# Altium schematic sheet PowerSupply.SchDoc
size 431 x 279 mm; Organization: ORGANIZATION; Address1: ADDRESS 1; Address2: ADDRESS 2; Address3: ADDRESS 3; Address4: ADDRESS 4; Revision: -; SheetNumber: 3; SheetTotal: 5; ENG_APP_DATE: --/--/--; DSN_APP_DATE: --/--/--; CHK_APP_DATE: --/--/--
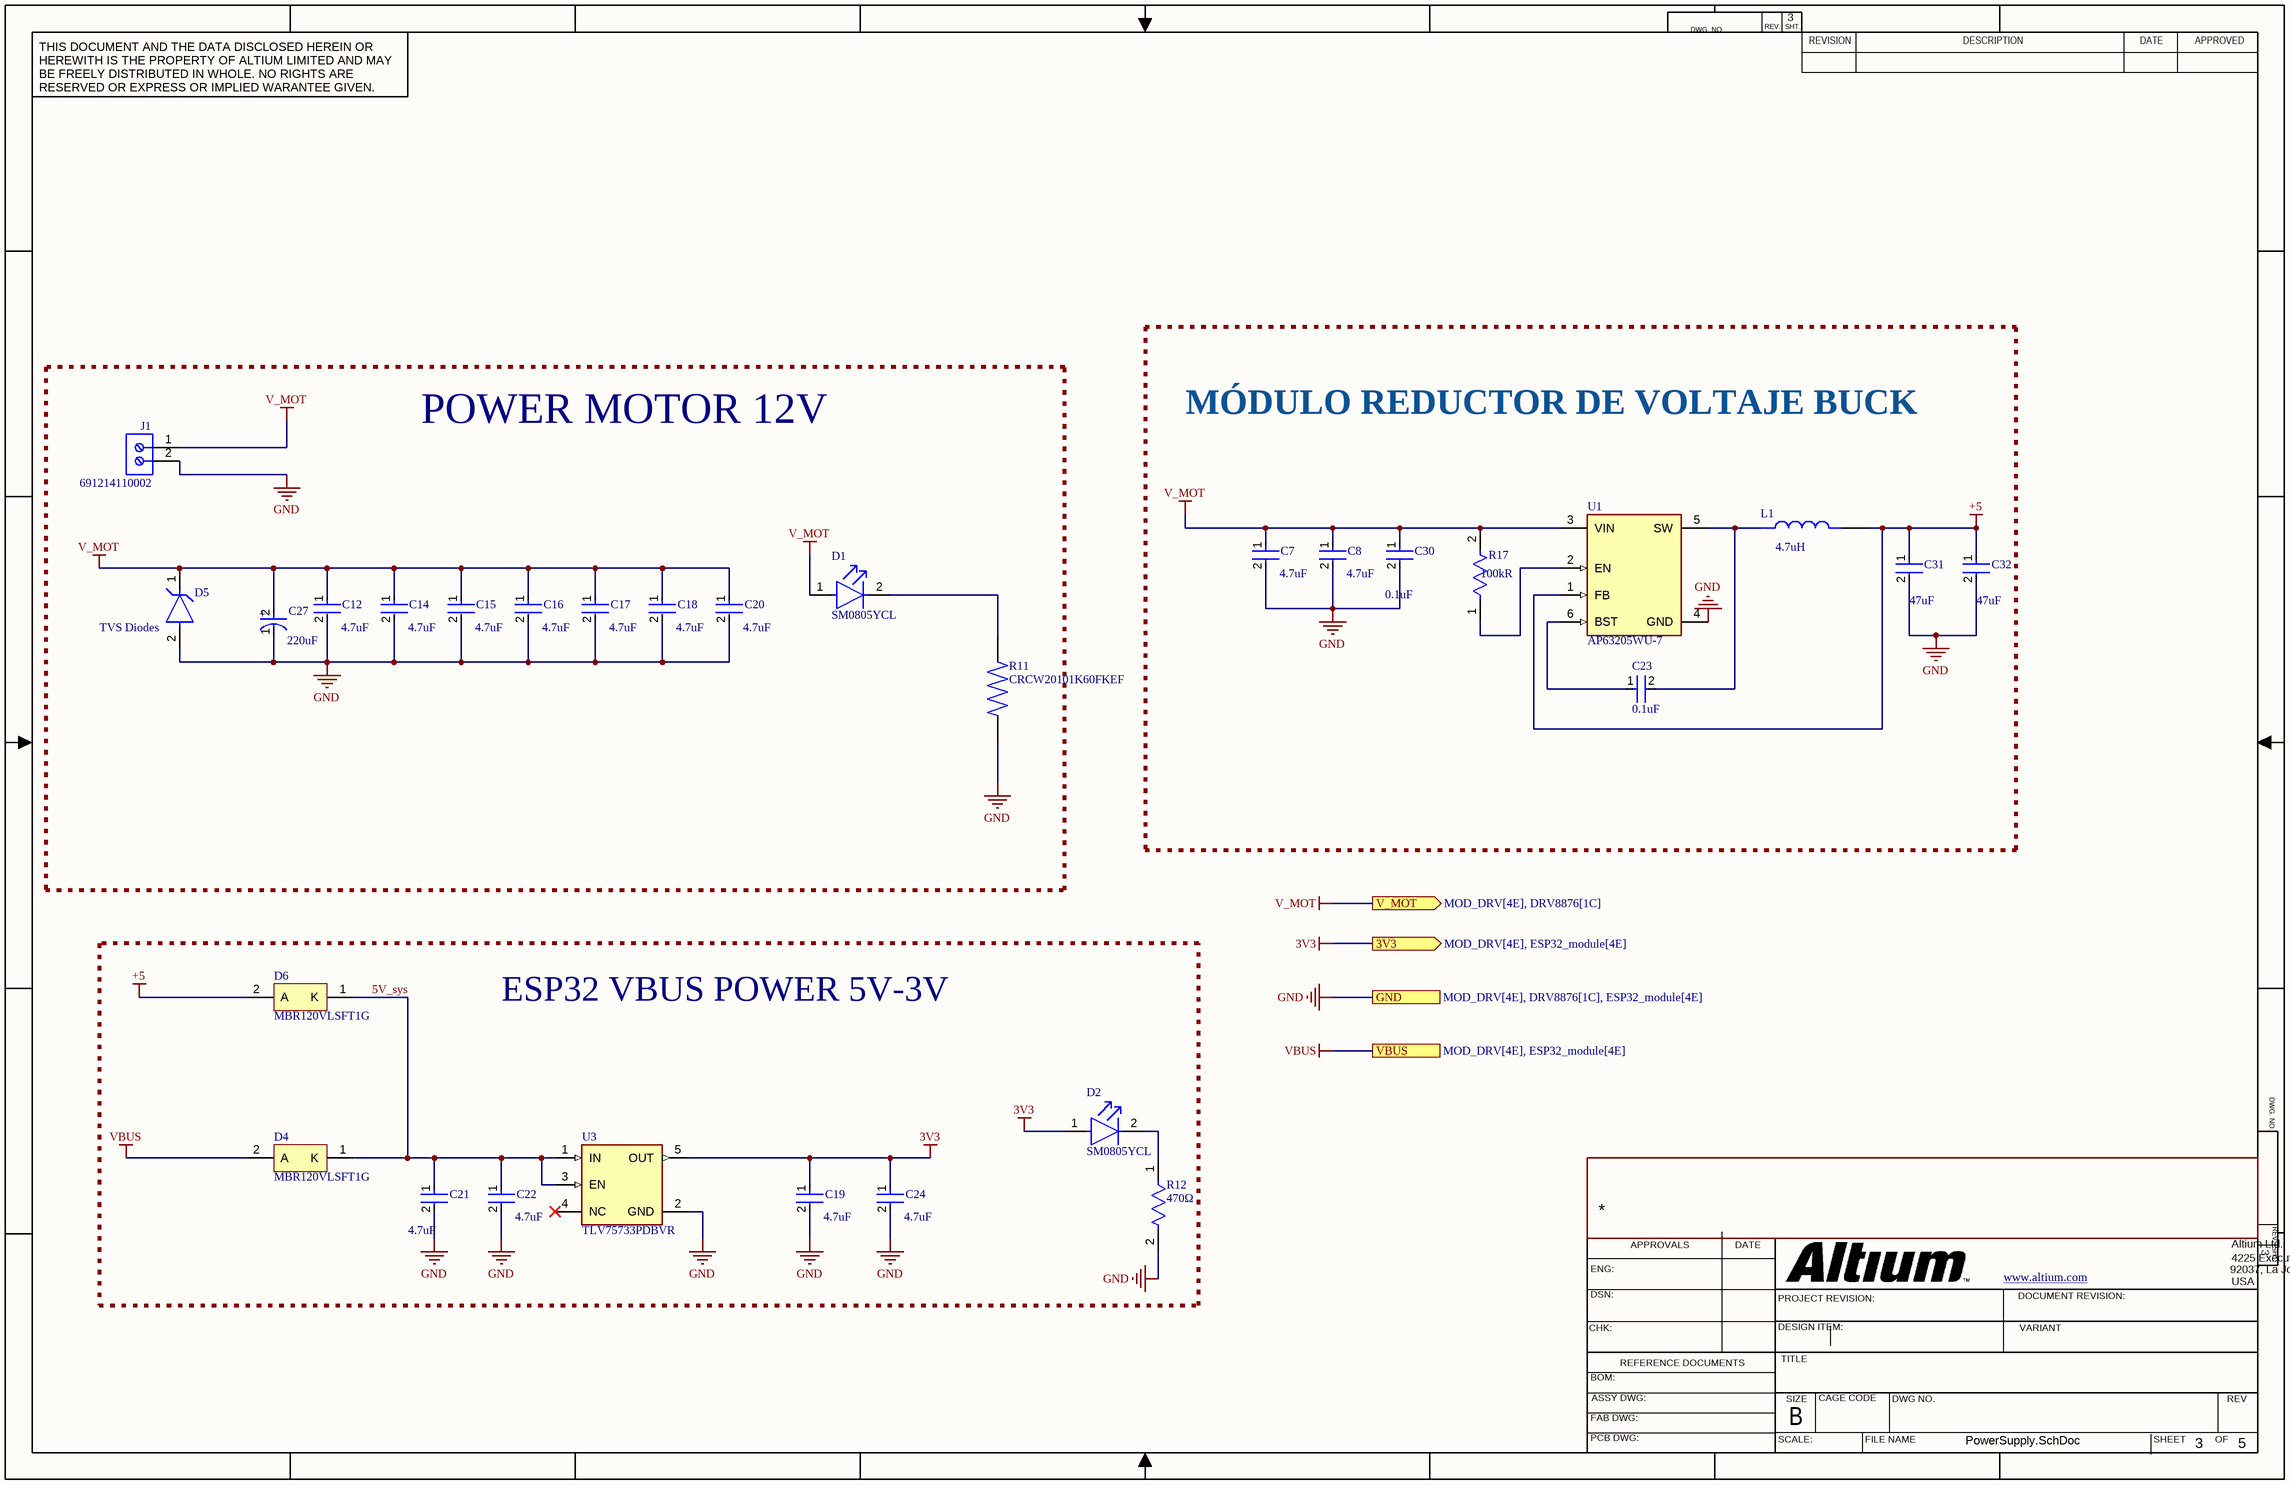
[diagram p0: PowerSupply.SchDoc]

## Parts
C7  Parameter 1: 4.7uF  [FP-GRM21B-0_2-e0_2_0_7-IPC_A]  (hidden comment: GRM21BZ7YA475KE15K)
C8  Parameter 1: 4.7uF  [FP-GRM21B-0_2-e0_2_0_7-IPC_A]  (hidden comment: GRM21BZ7YA475KE15K)
C12  Parameter 1: 4.7uF  [FP-GRM21B-0_2-e0_2_0_7-IPC_A]  (hidden comment: GRM21BZ7YA475KE15K)
C14  Parameter 1: 4.7uF  [FP-GRM21B-0_2-e0_2_0_7-IPC_A]  (hidden comment: GRM21BZ7YA475KE15K)
C15  Parameter 1: 4.7uF  [FP-GRM21B-0_2-e0_2_0_7-IPC_A]  (hidden comment: GRM21BZ7YA475KE15K)
C16  Parameter 1: 4.7uF  [FP-GRM21B-0_2-e0_2_0_7-IPC_A]  (hidden comment: GRM21BZ7YA475KE15K)
C17  Parameter 1: 4.7uF  [FP-GRM21B-0_2-e0_2_0_7-IPC_A]  (hidden comment: GRM21BZ7YA475KE15K)
C18  Parameter 1: 4.7uF  [FP-GRM21B-0_2-e0_2_0_7-IPC_A]  (hidden comment: GRM21BZ7YA475KE15K)
C19  Parameter 1: 4.7uF  [FP-GRM21B-0_2-e0_2_0_7-IPC_A]  (hidden comment: GRM21BZ7YA475KE15K)
C20  Parameter 1: 4.7uF  [FP-GRM21B-0_2-e0_2_0_7-IPC_A]  (hidden comment: GRM21BZ7YA475KE15K)
C21  Parameter 1: 4.7uF  [FP-GRM21B-0_2-e0_2_0_7-IPC_A]  (hidden comment: GRM21BZ7YA475KE15K)
C22  Parameter 1: 4.7uF  [FP-GRM21B-0_2-e0_2_0_7-IPC_A]  (hidden comment: GRM21BZ7YA475KE15K)
C23  Parameter 1: 0.1uF  [FP-GRM155-0_05-MFG]  (hidden comment: GRM155R71H104KE14D)
C24  Parameter 1: 4.7uF  [FP-GRM21B-0_2-e0_2_0_7-IPC_A]  (hidden comment: GRM21BZ7YA475KE15K)
C27  value 220uF  [FP-ZAG-MFG]  (hidden comment: EEH-ZA1V221P)
C30  Parameter 1: 0.1uF  [FP-GRM155-0_05-MFG]  (hidden comment: GRM155R71H104KE14D)
C31  Capacitance: 47uF  [FP-GRM31C-0_3-IPC_C]  (hidden comment: GRM31CR61E476ME44L)
C32  Capacitance: 47uF  [FP-GRM31C-0_3-IPC_C]  (hidden comment: GRM31CR61E476ME44L)
D1  SM0805YCL  [FP-SM0805YCL-MFG]
D2  SM0805YCL  [FP-SM0805YCL-MFG]
D4  MBR120VLSFT1G  [ONSC-SOD-123FL-2-498-01_V]
D5  Device Class L2: TVS Diodes  [FP-SMA-MFG]  (hidden comment: SMAJ15A)
D6  MBR120VLSFT1G  [ONSC-SOD-123FL-2-498-01_V]
J1  691214110002  [691214110002]
L1  value 4.7uH  [IND_SRP4020TA4R7M]  (hidden comment: SRP4020TA4R7M)
R11  CRCW20101K60FKEF  [RESC5025X70N]
R12  value 470Ω  [FP-AC0805-MFG]  (hidden comment: AC0805FR-07470RL)
R17  Resistance: 100kR  [FP-RC0805-0_6-IPC_C]  (hidden comment: RC0805FR-07100KL)
U1  AP63205WU-7  [FP-TSOT26-MFG]
U3  TLV75733PDBVR  [FP-DBV0005A-MFG]

## Blocks framed on the sheet
POWER MOTOR 12V: C12 C14-C18 C20 C27 D1 D5 J1 R11
ESP32 VBUS POWER 5V-3V: C19 C21 C22 C24 D2 D4 D6 R12 U3

## Ports
3V3 (out, see MOD_DRV[4E], ESP32_module[4E]), GND (see MOD_DRV[4E], DRV8876[1C], ESP32_module[4E]), V_MOT (out, see MOD_DRV[4E], DRV8876[1C]), VBUS (see MOD_DRV[4E], ESP32_module[4E])

## Nets
3V3: C19.1 C24.1 D2.1(A) U3.5(OUT) ; port 3V3
+5: C31.1 C32.1 D6.2(A) L1.2 U1.1(FB)
GND: C7.2 C8.2 C12.2 C14.2 C15.2 C16.2 C17.2 C18.2 C19.2 C20.2 C21.2 C22.2 C24.2 C27.1(C) C30.2 C31.2 C32.2 D5.2(A) J1.2 R11.1 R12.2 U1.4(GND) U3.2(GND) ; port GND
V_MOT: C7.1 C8.1 C12.1 C14.1 C15.1 C16.1 C17.1 C18.1 C20.1 C27.2(A) C30.1 D1.1(A) D5.1(C) J1.1 R17.2 U1.3(VIN) ; port V_MOT
VBUS: D4.2(A) ; port VBUS
5V_sys: C21.1 C22.1 D4.1(K) D6.1(K) U3.1(IN) U3.3(EN)
NetC23_1: C23.1 U1.6(BST)
NetC23_2: C23.2 L1.1 U1.5(SW)
NetD1_2: D1.2(C) R11.2
NetD2_2: D2.2(C) R12.1
NetR17_1: R17.1 U1.2(EN)

Not connected (* = marked no-connect by the designer): U3 4(NC)*

## Notes on the sheet
- MÓDULO REDUCTOR DE VOLTAJE BUCK
- DWG. NO.
- REV.
- SHT.
- THIS DOCUMENT AND THE DATA DISCLOSED HEREIN OR HEREWITH IS THE PROPERTY OF ALTIUM LIMITED AND MAY BE FREELY DISTRIBUTED IN WHOLE. NO RIGHTS ARE RESERVED OR EXPRESS OR IMPLIED WARANTEE GIVEN.
- REVISION
- DESCRIPTION
- DATE
- APPROVED
- ENG:
- DSN:
- APPROVALS
- PROJECT REVISION:
- www.altium.com <http://www.altium.com>
- DOCUMENT REVISION:
- 92037, La Jolla
- USA
- Altium Ltd.
- 4225 Executive Square
- CHK:
- REFERENCE DOCUMENTS
- DESIGN ITEM:
- TITLE
- VARIANT
- BOM:
- FAB DWG:
- PCB DWG:
- ASSY DWG:
- SCALE:
- SIZE
- B
- CAGE CODE
- FILE NAME
- DWG NO.
- SHEET
- OF
- REV
- (in symbol CMP-05428-000011-1) +

## Library data of the parts
C7 C8 C12 C14-C22 C24 = CMP-06035-048385-1: Chip Multilayer Ceramic Capacitors for General Purpose, 0805, 4.7uF, X7R, 15%, 10%, 35V. GRM21BZ7YA475KE15K
C23 C30 = CMP-06035-062118-1: Chip Multilayer Ceramic Capacitors for General Purpose, 0402, 0.10uF, X7R, 15%, 20%, 50V; RoHS Compliant: Yes
C27 = CMP-05428-000011-1: HYBRID SMD 35V220UF 105DEGC 1000; Manufacturer: Panasonic; Ripple Current: 2500mA; Leakage Current: 77uA; Material: Polymer; Tolerance: 20%; Esr: 20mΩ; Automotive Grade: Grade 2; Life: 10000Hours; Dissipation Factor: 12%; Voltage Rating: 35V; Octopart: https://octopart.com/eeh-za1v221p-panasonic-103134281; Temperature: -55°C to +105°C; ComponentLink2URL: https://b2b-api.panasonic.eu/file_stream/pids/fileversion/41; Device Class L2: Capacitors; Mouser Description: Capacitor Aluminum Polymer 220uF 20% 35V 2-Pin Surface Mount Paper T/R; Temperature Range High: +105°C; Automotive: Yes; RoHS: TRUE; Capacitance: 220uF; Height: 10.5mm; Manufacturer Part Number: EEH-ZA1V221P; Lead Free: Yes; Package: ZAG; Footprint Url: https://b2b-api.panasonic.eu/file_stream/pids/fileversion/37; Digikey Description: HYBRID SMD 35V220UF 105DEGC 1000; Device Class L1: Passive Components; Device Class L3: Polymer Capacitors; Category: Cap; ComponentLink2Description: Datasheet; Temperature Range Low: -55°C
C31 C32 = CMP-06035-000147-1: CAP CER 47UF 25V X5R 1206; Tolerance: 20%; Width: 1.6mm; Dielectric: X5R; Thickness: 1.6mm; Length: 3.2mm; Voltage Rating (DC): 25V
D1 D2 = CMP-35283-000007-1: LED YELLOW CLEAR 0805 SMD; Luminous Intensity: 11.5mcd; Test Current: 2mA; Viewing Angle: 130°; Dominant Wavelength: 592nm; Forward Voltage: 1.9V; Lens Color: Colorless; Case Code (Metric): 2012; Illumination Color: Yellow; Length: 2mm; Max Operating Temperature: 80°C; Width: 1.2mm; Case Code (Imperial): 0805; Packaging: Tape and Reel; Lens Transparency: Clear; Mount: Surface Mount; Case/Package: 0805; Forward Current: 2mA; Height: 0.8mm; Lead Free: Lead Free; Min Operating Temperature: -30°C; Color: Yellow; Package Quantity: 4000
D4 D6 = CMP-1055-00449-1: Schottky Power Rectifier, 2-Pin SOD-123, Pb-Free, Tape and Reel; Manufacturer: On Semiconductor; IFSM Max (A): 45; Configuration: Single; PackageDescription: 2-Pin SOD, Body 1.65 x 2.7 mm; RoHS: TRUE; ComponentLink2URL: http://www.onsemi.cn/pub_link/Collateral/MBR120VLSFT1-D.PDF; Mounting Technology: Surface Mount; ComponentLink1Description: Manufacturer URL; DatasheetVersion: Rev. 2; ComponentLink3Description: Package Specification; Packing: Tape and Reel; ComponentLink2Description: Datasheet; ComponentLink1URL: http://www.onsemi.com/; PackageVersion: Rev. A; PackageReference: SOD-123FL-2-498-01; ComponentLink3URL: http://www.onsemi.cn/pub_link/Collateral/MBR120VLSFT1-D.PDF; PartNumber: MBR120VLSFT1G
D5 = CMP-07401-000026-1: TVS DIODE 15V 24.4V SMA; Manufacturer: Bourns Inc.; Description: 24.4V Clamp 16.4A Ipp Tvs Diode Surface Mount SMA (DO-214AC); Max Junction Temp: +150°C; Peak Pulse Current: 16.4A; Direction: Unidirectional; Breakdown Voltage: 16.7V; Number Of Channels: 1; Peak Pulse Power: 400W; Mouser Description: Bourns Smaj15a / Diode Tvs 15v 400w Uni 5% Smd Bourns; Temperature Range Low: -55°C; ComponentLink2Description: Datasheet; Package: SMA; Reverse Standoff Voltage: 15V; Category: Diode; Lead Free: Yes; RoHS: TRUE; Clamping Voltage: 24.4V; ComponentLink2URL: https://www.bourns.com/docs/Product-Datasheets/SMAJ.pdf; Digikey Description: TVS DIODE 15V 24.4V SMA; Temperature Range High: +150°C; Height: 2.29mm; Device Class L1: Circuit Protection; Device Class L3: unset; Temperature: -55°C to +150°C; Octopart: https://octopart.com/smaj15a-bourns-12809353; Manufacturer Part Number: SMAJ15A; Automotive: No
J1 = CMP-1502-02464-3: 2141 Series 3.5MM Pitch Straight, Pcb Terminal Block, Through Hole, 2 Way; Plating: Brass, Steel; Wire Gauge (Min): 16AWG; Number of Contacts: 2; Current: 10A; Stripping Length: -6mm; Voltage Rating: 300V; Pitch: 3.5052mm; Wire Gauge (Max): 24AWG; Number of Levels: 1; Lead Pitch: 3.5mm; Width: 7.9mm; Packaging: Box; RoHS: Compliant; Number of Rows: 1; Min Operating Temperature: -40°C; Mount: Through Hole; Number of Pins: 2; Contact Plating: Brass, Tin; Housing Material: Nylon; Current Rating: 10A; Termination: Screw; Color: Blue, Green; Number of Positions Per Level: 2; Height: 8.7mm; Voltage: 300V; Max Operating Temperature: 105°C; Wire/Cable Gauge: 24AWG; Length: 7.4mm; Contact Material: Tin
L1 = SRP4020TA4R7M: Inductor Power Shielded Wirewound 4.7uH 20% 100KHz 10Q-Factor Carbonyl Powder 2.6A 0.105Ohm DCR 1616 Automotive T/R; MF: Bourns; Availability: In Stock; Check_prices: https://www.snapeda.com/parts/SRP4020TA4R7M/Bourns/view-part/?ref=eda; Package: None; Price: None; Purchase-URL: https://pricing.snapeda.com/search/part/SRP4020TA4R7M/?ref=eda; SnapEDA_Link: https://www.snapeda.com/parts/SRP4020TA4R7M/Bourns/view-part/?ref=snap; MP: SRP4020TA4R7M
R11 = CRCW20101K60FKEF: 1.6 kOhms Â±1% 0.75W, 3/4W Chip Resistor 2010 (5025 Metric) Automotive AEC-Q200 Thick Film; MF: Vishay; SnapEDA_Link: https://www.snapeda.com/parts/CRCW20101K60FKEF/Vishay/view-part/?ref=snap; Package: 5025 Vishay; Value: *; MP: CRCW20101K60FKEF; Check_prices: https://www.snapeda.com/parts/CRCW20101K60FKEF/Vishay/view-part/?ref=eda
R12 = CMP-03412-037267-1: RES SMD 470 OHM 1% 1/8W 0805; Manufacturer: Yageo; Automotive Grade: Grade 0; Tolerance: 0.01; Voltage Rating: 150V; Package: AC0805; Device Class L3: Chip SMD Resistors; Composition: Thick Film; Ipc Land Pattern Name: RESC200125X50; Height: 0.6mm; Device Class L1: Passive Components; Series: AC; Resistance: 470Ω; RoHS: TRUE; Automotive: Yes; ComponentLink2Description: Datasheet; Power Rating: 1/8W; Temperature Range Low: -55°C; Category: Res; Digikey Description: RES SMD 470 OHM 1% 1/8W 0805; Temperature: -55°C to +155°C; ComponentLink2URL: http://www.yageo.com/documents/recent/PYu-AC_51_RoHS_L_6.pdf; Manufacturer Part Number: AC0805FR-07470RL; Mouser Description: Thick Film Resistors 1/8W 470ohm 1% AEC-Q200; Lead Free: Yes; Temperature Range High: +155°C; Device Class L2: Resistors; Octopart: https://octopart.com/ac0805fr-07470rl-yageo-26633242; Footprint Url: http://www.yageo.com/exep/pages/download/literatures/PYu-R_Mount_10.pdf
R17 = CMP-2100-03668-5: RES 100K OHM 1% 1/8W 0805; Power Rating: 125mW; Temperature Coefficient: 100ppm/°C; Voltage Rating (DC): 150V; Package Quantity: 1; Case/Package: 0805; Lead Pitch: 0.4mm; Case Code (Imperial): 0805; Construction: Rectangular; Number of Terminations: 2; RoHS Compliant: Yes; Max Power Dissipation: 125mW; Tolerance: 1%; Max Operating Temperature: 155°C; Resistance Tolerance: 1%; Lead Free: Lead Free; Packaging: Tape and Reel; Resistor Type: Thick Film; Min Operating Temperature: -55°C; Case Code (Metric): 2012; Series: RC; Technology: THICK FILM; Voltage Rating: 150V; Termination: SMD/SMT; Width: 0.049inch; Number of Pins: 2; Features: Moisture Resistant; Military Standard: Not; Length: 0.079inch; Depth: 1.25mm; Size Code: 0805; Height: 0.024inch
U1 = CMP-12757-000001-1: IC REG BUCK 5V 2A TSOT26; Manufacturer: Diodes Inc.; Max Junction Temp: +160°C; Max Duty Cycle: 100%; Standoff Height: 0.01mm; Max Supply Voltage: 32V; Number Of Outputs: 1; Description: Buck Switching Regulator IC Positive Fixed 5V 1 Output 2A SOT-23-6 Thin, TSOT-23-6; Min Supply Voltage: 3.8V; Output Type: Fixed; Switching Frequency: 1100kHz; Nominal Supply Current: 22uA; Automotive: No; RoHS: TRUE; Switching Topology: Buck; Temperature: -40°C to +85°C; Footprint Url: https://www.diodes.com/assets/Package-Files/TSOT26.pdf; Lead Free: Yes; Digikey Description: IC REG BUCK 5V 2A TSOT26; Device Class L3: Voltage Regulators - Switching; Ambient Temperature Range High: +85°C; Category: IC; Package: TSOT26; Output Voltage: 5V; Output Current: 2A; ComponentLink2Description: Datasheet; Device Class L2: Power Management ICs; Ambient Temperature Range Low: -40°C; Temperature Range High: +85°C; Temperature Range Low: -40°C; Octopart: https://octopart.com/ap63205wu-7-diodes+inc.-98099551; Manufacturer Part Number: AP63205WU-7; Height: 1mm; Device Class L1: Integrated Circuits (ICs); ComponentLink2URL: https://www.diodes.com/assets/Datasheets/AP63200-AP63201-AP63203-AP63205.pdf
U3 = CMP-04917-000028-1: IC REG LINEAR 3.3V 1A SOT23-5; Manufacturer: Texas Instruments; Standoff Height: 0mm; Description: Linear Voltage Regulator IC 1 Output 1A SOT-23-5; Min Supply Voltage: 1.45V; Dropout Voltage: 1350mV; Output Type: Fixed; Max Junction Temp: +125°C; Max Supply Voltage: 5.5V; Number Of Outputs: 1; Accuracy Percentage: 1%; Manufacturer Part Number: TLV75733PDBVR; ComponentLink2Description: Datasheet; Temperature: -40°C to +125°C; RoHS: TRUE; ComponentLink2URL: http://www.ti.com/lit/ds/symlink/tlv757p.pdf; Output Voltage: 3.3V; Mouser Description: 1-A low-IQ small-size low-dropout (LDO) regulator 5-SOT-23 -40 to 125; Ipc Land Pattern Name: SOT95P280X145-5; Device Class L2: Power Management ICs; Package: DBV0005A; Height: 1.45mm; Category: IC; Digikey Description: IC REG LINEAR 3.3V 1A SOT23-5; Temperature Range High: +125°C; Octopart: https://octopart.com/tlv75733pdbvr-texas+instruments-91437073; Temperature Range Low: -40°C; Device Class L3: Voltage Regulators - Linear; Output Current: 1A; Device Class L1: Integrated Circuits (ICs); Automotive: No; Lead Free: Yes